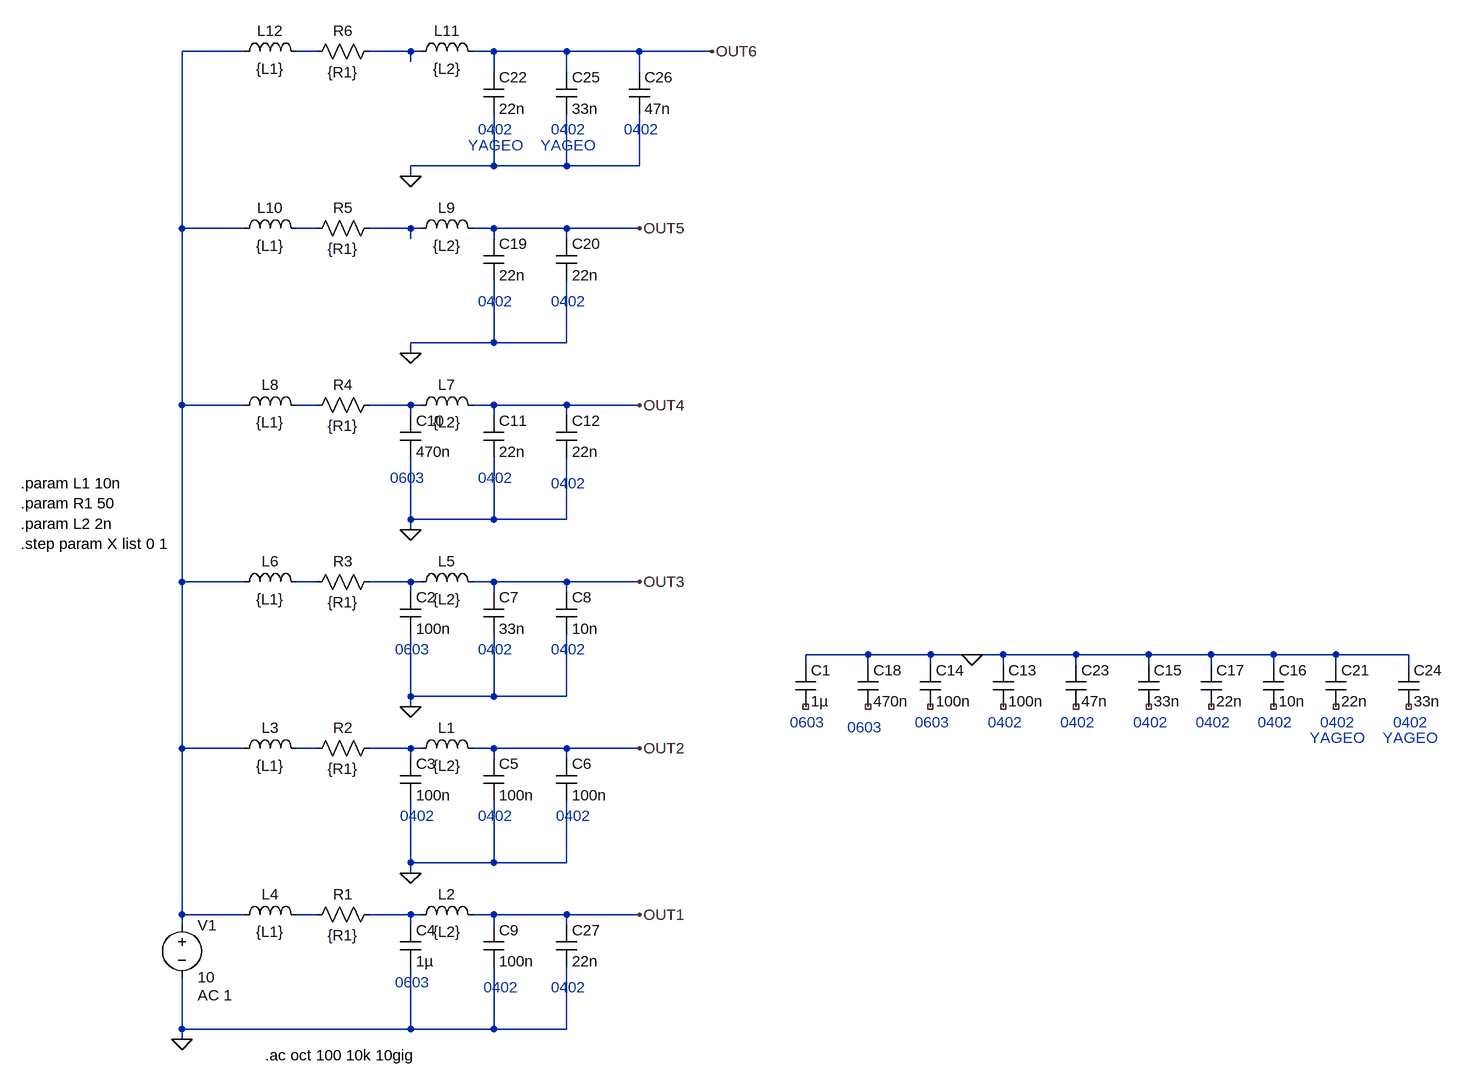
[diagram p0: schematic capacitors_antiresonance2.asc]
capacitors_antiresonance2.asc, the LTspice schematic file:
Version 4
SHEET 1 1688 680
WIRE -160 -1200 -256 -1200
WIRE -48 -1200 -80 -1200
WIRE 96 -1200 32 -1200
WIRE 112 -1200 96 -1200
WIRE 224 -1200 192 -1200
WIRE 336 -1200 224 -1200
WIRE 448 -1200 336 -1200
WIRE 560 -1200 448 -1200
WIRE 96 -1184 96 -1200
WIRE 224 -1168 224 -1200
WIRE 336 -1168 336 -1200
WIRE 448 -1168 448 -1200
WIRE 224 -1024 224 -1104
WIRE 224 -1024 96 -1024
WIRE 336 -1024 336 -1104
WIRE 336 -1024 224 -1024
WIRE 448 -1024 448 -1104
WIRE 448 -1024 336 -1024
WIRE 96 -1008 96 -1024
WIRE -256 -928 -256 -1200
WIRE -160 -928 -256 -928
WIRE -48 -928 -80 -928
WIRE 96 -928 32 -928
WIRE 112 -928 96 -928
WIRE 224 -928 192 -928
WIRE 336 -928 224 -928
WIRE 448 -928 336 -928
WIRE 96 -912 96 -928
WIRE 224 -912 224 -928
WIRE 336 -912 336 -928
WIRE 224 -752 224 -848
WIRE 224 -752 96 -752
WIRE 336 -752 336 -848
WIRE 336 -752 224 -752
WIRE 96 -736 96 -752
WIRE -256 -656 -256 -928
WIRE -160 -656 -256 -656
WIRE -48 -656 -80 -656
WIRE 96 -656 32 -656
WIRE 112 -656 96 -656
WIRE 224 -656 192 -656
WIRE 336 -656 224 -656
WIRE 448 -656 336 -656
WIRE 96 -640 96 -656
WIRE 224 -640 224 -656
WIRE 336 -640 336 -656
WIRE 96 -480 96 -576
WIRE 224 -480 224 -576
WIRE 224 -480 96 -480
WIRE 336 -480 336 -576
WIRE 336 -480 224 -480
WIRE 96 -464 96 -480
WIRE -256 -384 -256 -656
WIRE -160 -384 -256 -384
WIRE -48 -384 -80 -384
WIRE 96 -384 32 -384
WIRE 112 -384 96 -384
WIRE 224 -384 192 -384
WIRE 336 -384 224 -384
WIRE 448 -384 336 -384
WIRE 96 -368 96 -384
WIRE 224 -368 224 -384
WIRE 336 -368 336 -384
WIRE 800 -272 704 -272
WIRE 896 -272 800 -272
WIRE 960 -272 896 -272
WIRE 1008 -272 960 -272
WIRE 1120 -272 1008 -272
WIRE 1232 -272 1120 -272
WIRE 1328 -272 1232 -272
WIRE 1424 -272 1328 -272
WIRE 1520 -272 1424 -272
WIRE 1632 -272 1520 -272
WIRE 704 -256 704 -272
WIRE 800 -256 800 -272
WIRE 896 -256 896 -272
WIRE 1008 -256 1008 -272
WIRE 1120 -256 1120 -272
WIRE 1232 -256 1232 -272
WIRE 1328 -256 1328 -272
WIRE 1424 -256 1424 -272
WIRE 1520 -256 1520 -272
WIRE 1632 -256 1632 -272
WIRE 96 -208 96 -304
WIRE 224 -208 224 -304
WIRE 224 -208 96 -208
WIRE 336 -208 336 -304
WIRE 336 -208 224 -208
WIRE 96 -192 96 -208
WIRE -256 -128 -256 -384
WIRE -160 -128 -256 -128
WIRE -48 -128 -80 -128
WIRE 96 -128 32 -128
WIRE 112 -128 96 -128
WIRE 224 -128 192 -128
WIRE 336 -128 224 -128
WIRE 448 -128 336 -128
WIRE 96 -112 96 -128
WIRE 224 -112 224 -128
WIRE 336 -112 336 -128
WIRE 96 48 96 -48
WIRE 224 48 224 -48
WIRE 224 48 96 48
WIRE 336 48 336 -48
WIRE 336 48 224 48
WIRE 96 64 96 48
WIRE -256 128 -256 -128
WIRE -160 128 -256 128
WIRE -48 128 -80 128
WIRE 96 128 32 128
WIRE 112 128 96 128
WIRE 224 128 192 128
WIRE 336 128 224 128
WIRE 448 128 336 128
WIRE -256 144 -256 128
WIRE 96 144 96 128
WIRE 224 144 224 128
WIRE 336 144 336 128
WIRE -256 304 -256 224
WIRE 96 304 96 208
WIRE 96 304 -256 304
WIRE 224 304 224 208
WIRE 224 304 96 304
WIRE 336 304 336 208
WIRE 336 304 224 304
WIRE -256 320 -256 304
FLAG -256 320 0
FLAG 448 128 OUT1
FLAG 448 -128 OUT2
FLAG 96 64 0
FLAG 448 -384 OUT3
FLAG 96 -192 0
FLAG 448 -656 OUT4
FLAG 96 -464 0
FLAG 960 -272 0
FLAG 448 -928 OUT5
FLAG 96 -736 0
FLAG 560 -1200 OUT6
FLAG 96 -1008 0
SYMBOL voltage -256 128 R0
WINDOW 123 24 124 Left 2
WINDOW 39 24 152 Left 2
SYMATTR Value2 AC 1
SYMATTR InstName V1
SYMATTR Value 10
SYMBOL res 48 112 R90
WINDOW 0 0 56 VBottom 2
WINDOW 3 32 56 VTop 2
SYMATTR InstName R1
SYMATTR Value {R1}
SYMBOL res 48 -144 R90
WINDOW 0 0 56 VBottom 2
WINDOW 3 32 56 VTop 2
SYMATTR InstName R2
SYMATTR Value {R1}
SYMBOL cap 80 144 R0
SYMATTR InstName C4
SYMATTR Value 1µ
SYMATTR SpiceLine V=50 Irms=940m Rser=6.4m Lser={532p+X*1200p}
SYMBOL ind 96 -112 R270
WINDOW 0 32 56 VTop 2
WINDOW 3 5 56 VBottom 2
SYMATTR InstName L1
SYMATTR Value {L2}
SYMBOL ind 96 144 R270
WINDOW 0 32 56 VTop 2
WINDOW 3 5 56 VBottom 2
SYMATTR InstName L2
SYMATTR Value {L2}
SYMBOL ind -176 -112 R270
WINDOW 0 32 56 VTop 2
WINDOW 3 5 56 VBottom 2
SYMATTR InstName L3
SYMATTR Value {L1}
SYMBOL ind -176 144 R270
WINDOW 0 32 56 VTop 2
WINDOW 3 5 56 VBottom 2
SYMATTR InstName L4
SYMATTR Value {L1}
SYMBOL res 48 -400 R90
WINDOW 0 0 56 VBottom 2
WINDOW 3 32 56 VTop 2
SYMATTR InstName R3
SYMATTR Value {R1}
SYMBOL ind 96 -368 R270
WINDOW 0 32 56 VTop 2
WINDOW 3 5 56 VBottom 2
SYMATTR InstName L5
SYMATTR Value {L2}
SYMBOL ind -176 -368 R270
WINDOW 0 32 56 VTop 2
WINDOW 3 5 56 VBottom 2
SYMATTR InstName L6
SYMATTR Value {L1}
SYMBOL cap 80 -368 R0
SYMATTR InstName C2
SYMATTR Value 100n
SYMATTR SpiceLine V=50 Irms=940m Rser=22m Lser=281p
SYMBOL cap 208 -368 R0
SYMATTR InstName C7
SYMATTR Value 33n
SYMATTR SpiceLine V=50 Irms=940m Rser=32m Lser=244p
SYMBOL cap 320 -368 R0
SYMATTR InstName C8
SYMATTR Value 10n
SYMATTR SpiceLine V=50 Irms=247m Rser=66m Lser=243p
SYMBOL cap 208 144 R0
SYMATTR InstName C9
SYMATTR Value 100n
SYMATTR SpiceLine V=50 Irms=940m Rser=20m Lser={280p+X*600p}
SYMBOL res 48 -672 R90
WINDOW 0 0 56 VBottom 2
WINDOW 3 32 56 VTop 2
SYMATTR InstName R4
SYMATTR Value {R1}
SYMBOL ind 96 -640 R270
WINDOW 0 32 56 VTop 2
WINDOW 3 5 56 VBottom 2
SYMATTR InstName L7
SYMATTR Value {L2}
SYMBOL ind -176 -640 R270
WINDOW 0 32 56 VTop 2
WINDOW 3 5 56 VBottom 2
SYMATTR InstName L8
SYMATTR Value {L1}
SYMBOL cap 208 -640 R0
SYMATTR InstName C11
SYMATTR Value 22n
SYMATTR SpiceLine V=50 Irms=247m Rser=30m Lser=290p
SYMBOL cap 80 -640 R0
SYMATTR InstName C10
SYMATTR Value 470n
SYMATTR SpiceLine V=50 Irms=940m Rser=8.8m Lser=498p
SYMBOL cap 688 -256 R0
SYMATTR InstName C1
SYMATTR Value 1µ
SYMATTR SpiceLine V=50 Irms=940m Rser=6.4m Lser=532p
SYMBOL cap 992 -256 R0
SYMATTR InstName C13
SYMATTR Value 100n
SYMATTR SpiceLine V=50 Irms=940m Rser=20m Lser=281p
SYMBOL cap 80 -112 R0
SYMATTR InstName C3
SYMATTR Value 100n
SYMATTR SpiceLine V=50 Irms=940m Rser=20m Lser=281p
SYMBOL cap 208 -112 R0
SYMATTR InstName C5
SYMATTR Value 100n
SYMATTR SpiceLine V=50 Irms=940m Rser=20m Lser=281p
SYMBOL cap 320 -112 R0
SYMATTR InstName C6
SYMATTR Value 100n
SYMATTR SpiceLine V=50 Irms=940m Rser=20m Lser=281p
SYMBOL cap 880 -256 R0
SYMATTR InstName C14
SYMATTR Value 100n
SYMATTR SpiceLine V=50 Irms=940m Rser=22m Lser=281p
SYMBOL cap 1216 -256 R0
SYMATTR InstName C15
SYMATTR Value 33n
SYMATTR SpiceLine V=50 Irms=940m Rser=32m Lser=244p
SYMBOL cap 1408 -256 R0
SYMATTR InstName C16
SYMATTR Value 10n
SYMATTR SpiceLine V=50 Irms=247m Rser=66m Lser=243p
SYMBOL cap 320 -640 R0
SYMATTR InstName C12
SYMATTR Value 22n
SYMATTR SpiceLine V=50 Irms=247m Rser=30m Lser=290p
SYMBOL cap 1312 -256 R0
SYMATTR InstName C17
SYMATTR Value 22n
SYMATTR SpiceLine V=50 Irms=247m Rser=30m Lser=290p
SYMBOL cap 784 -256 R0
SYMATTR InstName C18
SYMATTR Value 470n
SYMATTR SpiceLine V=50 Irms=940m Rser=8.8m Lser=498p
SYMBOL res 48 -944 R90
WINDOW 0 0 56 VBottom 2
WINDOW 3 32 56 VTop 2
SYMATTR InstName R5
SYMATTR Value {R1}
SYMBOL ind 96 -912 R270
WINDOW 0 32 56 VTop 2
WINDOW 3 5 56 VBottom 2
SYMATTR InstName L9
SYMATTR Value {L2}
SYMBOL ind -176 -912 R270
WINDOW 0 32 56 VTop 2
WINDOW 3 5 56 VBottom 2
SYMATTR InstName L10
SYMATTR Value {L1}
SYMBOL cap 208 -912 R0
SYMATTR InstName C19
SYMATTR Value 22n
SYMATTR SpiceLine V=50 Irms=247m Rser=30m Lser=290p
SYMBOL cap 320 -912 R0
SYMATTR InstName C20
SYMATTR Value 22n
SYMATTR SpiceLine V=50 Irms=247m Rser=30m Lser=290p
SYMBOL cap 1504 -256 R0
SYMATTR InstName C21
SYMATTR Value 22n
SYMATTR SpiceLine V=50 Irms=247m Rser=36m Lser=175p
SYMBOL res 48 -1216 R90
WINDOW 0 0 56 VBottom 2
WINDOW 3 32 56 VTop 2
SYMATTR InstName R6
SYMATTR Value {R1}
SYMBOL ind 96 -1184 R270
WINDOW 0 32 56 VTop 2
WINDOW 3 5 56 VBottom 2
SYMATTR InstName L11
SYMATTR Value {L2}
SYMBOL ind -176 -1184 R270
WINDOW 0 32 56 VTop 2
WINDOW 3 5 56 VBottom 2
SYMATTR InstName L12
SYMATTR Value {L1}
SYMBOL cap 208 -1168 R0
SYMATTR InstName C22
SYMATTR Value 22n
SYMATTR SpiceLine V=50 Irms=247m Rser=36m Lser=175p
SYMBOL cap 1616 -256 R0
SYMATTR InstName C24
SYMATTR Value 33n
SYMATTR SpiceLine V=50 Irms=247m Rser=32m Lser=181p
SYMBOL cap 320 -1168 R0
SYMATTR InstName C25
SYMATTR Value 33n
SYMATTR SpiceLine V=50 Irms=247m Rser=32m Lser=181p
SYMBOL cap 1104 -256 R0
SYMATTR InstName C23
SYMATTR Value 47n
SYMATTR SpiceLine V=50 Irms=940m Rser=31m Lser=278p
SYMBOL cap 432 -1168 R0
SYMATTR InstName C26
SYMATTR Value 47n
SYMATTR SpiceLine V=50 Irms=940m Rser=31m Lser=278p
SYMBOL cap 320 144 R0
SYMATTR InstName C27
SYMATTR Value 22n
SYMATTR SpiceLine V=50 Irms=247m Rser=66m Lser={180p+X*600p}
TEXT -128 344 Left 2 !.ac oct 100 10k 10gig
TEXT 72 232 Left 2 ;0603
TEXT 208 240 Left 2 ;0402
TEXT 80 -24 Left 2 ;0402
TEXT 200 -24 Left 2 ;0402
TEXT 320 -24 Left 2 ;0402
TEXT 72 -280 Left 2 ;0603
TEXT 200 -280 Left 2 ;0402
TEXT 312 -280 Left 2 ;0402
TEXT 312 -536 Left 2 ;0402
TEXT 200 -544 Left 2 ;0402
TEXT 64 -544 Left 2 ;0603
TEXT 680 -168 Left 2 ;0603
TEXT 984 -168 Left 2 ;0402
TEXT 872 -168 Left 2 ;0603
TEXT 1208 -168 Left 2 ;0402
TEXT 1400 -168 Left 2 ;0402
TEXT 1304 -168 Left 2 ;0402
TEXT 768 -160 Left 2 ;0603
TEXT 200 -816 Left 2 ;0402
TEXT 312 -816 Left 2 ;0402
TEXT 1496 -168 Left 2 ;0402
TEXT 1480 -144 Left 2 ;YAGEO
TEXT 200 -1080 Left 2 ;0402
TEXT 312 -1080 Left 2 ;0402
TEXT 184 -1056 Left 2 ;YAGEO
TEXT 296 -1056 Left 2 ;YAGEO
TEXT 1608 -168 Left 2 ;0402
TEXT 1592 -144 Left 2 ;YAGEO
TEXT 1096 -168 Left 2 ;0402
TEXT 424 -1080 Left 2 ;0402
TEXT -504 -536 Left 2 !.param L1 10n\n.param R1 50\n.param L2 2n\n.step param X list 0 1
TEXT 312 240 Left 2 ;0402

The netlist it stands for:
* capacitors_antiresonance2.asc
V1 N001 0 10 AC 1
R1 N013 N012 {R1}
R2 N011 N010 {R1}
C4 N013 0 1µ V=50 Irms=940m Rser=6.4m Lser={532p+X*1200p}
L1 N011 OUT2 {L2}
L2 N013 OUT1 {L2}
L3 N001 N010 {L1}
L4 N001 N012 {L1}
R3 N009 N008 {R1}
L5 N009 OUT3 {L2}
L6 N001 N008 {L1}
C2 N009 0 100n V=50 Irms=940m Rser=22m Lser=281p
C7 OUT3 0 33n V=50 Irms=940m Rser=32m Lser=244p
C8 OUT3 0 10n V=50 Irms=247m Rser=66m Lser=243p
C9 OUT1 0 100n V=50 Irms=940m Rser=20m Lser={280p+X*600p}
R4 N007 N006 {R1}
L7 N007 OUT4 {L2}
L8 N001 N006 {L1}
C11 OUT4 0 22n V=50 Irms=247m Rser=30m Lser=290p
C10 N007 0 470n V=50 Irms=940m Rser=8.8m Lser=498p
C1 0 NC_01 1µ V=50 Irms=940m Rser=6.4m Lser=532p
C13 0 NC_02 100n V=50 Irms=940m Rser=20m Lser=281p
C3 N011 0 100n V=50 Irms=940m Rser=20m Lser=281p
C5 OUT2 0 100n V=50 Irms=940m Rser=20m Lser=281p
C6 OUT2 0 100n V=50 Irms=940m Rser=20m Lser=281p
C14 0 NC_03 100n V=50 Irms=940m Rser=22m Lser=281p
C15 0 NC_04 33n V=50 Irms=940m Rser=32m Lser=244p
C16 0 NC_05 10n V=50 Irms=247m Rser=66m Lser=243p
C12 OUT4 0 22n V=50 Irms=247m Rser=30m Lser=290p
C17 0 NC_06 22n V=50 Irms=247m Rser=30m Lser=290p
C18 0 NC_07 470n V=50 Irms=940m Rser=8.8m Lser=498p
R5 N005 N004 {R1}
L9 N005 OUT5 {L2}
L10 N001 N004 {L1}
C19 OUT5 0 22n V=50 Irms=247m Rser=30m Lser=290p
C20 OUT5 0 22n V=50 Irms=247m Rser=30m Lser=290p
C21 0 NC_08 22n V=50 Irms=247m Rser=36m Lser=175p
R6 N003 N002 {R1}
L11 N003 OUT6 {L2}
L12 N001 N002 {L1}
C22 OUT6 0 22n V=50 Irms=247m Rser=36m Lser=175p
C24 0 NC_09 33n V=50 Irms=247m Rser=32m Lser=181p
C25 OUT6 0 33n V=50 Irms=247m Rser=32m Lser=181p
C23 0 NC_10 47n V=50 Irms=940m Rser=31m Lser=278p
C26 OUT6 0 47n V=50 Irms=940m Rser=31m Lser=278p
C27 OUT1 0 22n V=50 Irms=247m Rser=66m Lser={180p+X*600p}
.ac oct 100 10k 10gig
* 0603
* 0402
* 0402
* 0402
* 0402
* 0603
* 0402
* 0402
* 0402
* 0402
* 0603
* 0603
* 0402
* 0603
* 0402
* 0402
* 0402
* 0603
* 0402
* 0402
* 0402
* YAGEO
* 0402
* 0402
* YAGEO
* YAGEO
* 0402
* YAGEO
* 0402
* 0402
.param L1 10n
.param R1 50
.param L2 2n
.step param X list 0 1
* 0402
.backanno
.end